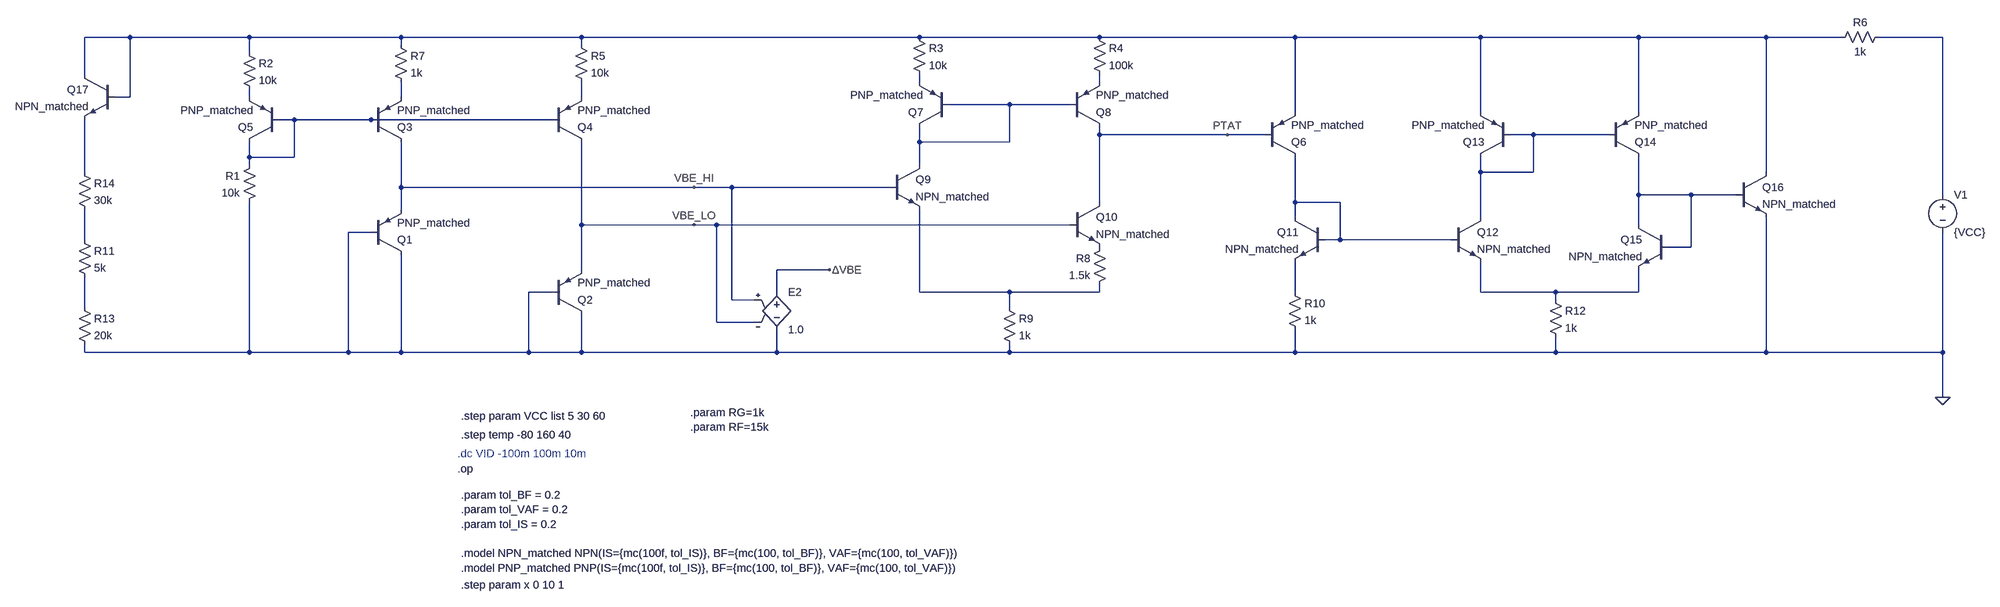
[diagram p0: schematic Shunt_Reference_1p2V.asc]
Shunt_Reference_1p2V.asc, the LTspice schematic file:
Version 4.1
SHEET 1 2692 1016
WIRE -1424 -416 -1520 -416
WIRE -1136 -416 -1424 -416
WIRE -768 -416 -1136 -416
WIRE -384 -416 -768 -416
WIRE 336 -416 -384 -416
WIRE 720 -416 336 -416
WIRE 1136 -416 720 -416
WIRE 1600 -416 1136 -416
WIRE 1936 -416 1600 -416
WIRE 2208 -416 1936 -416
WIRE 2368 -416 2208 -416
WIRE 2592 -416 2448 -416
WIRE -768 -400 -768 -416
WIRE -384 -400 -384 -416
WIRE -1136 -384 -1136 -416
WIRE -1520 -336 -1520 -416
WIRE 336 -320 336 -336
WIRE 720 -320 720 -336
WIRE -1424 -288 -1424 -416
WIRE -1424 -288 -1456 -288
WIRE -1136 -288 -1136 -304
WIRE -768 -288 -768 -320
WIRE -384 -288 -384 -320
WIRE 528 -272 400 -272
WIRE 656 -272 528 -272
WIRE 1136 -256 1136 -416
WIRE 1600 -256 1600 -416
WIRE 1936 -256 1936 -416
WIRE -1040 -240 -1072 -240
WIRE -832 -240 -1040 -240
WIRE -448 -240 -832 -240
WIRE 720 -208 720 -224
WIRE 992 -208 720 -208
WIRE 1072 -208 992 -208
WIRE 1712 -208 1664 -208
WIRE 1872 -208 1712 -208
WIRE 336 -192 336 -224
WIRE 528 -192 528 -272
WIRE 528 -192 336 -192
WIRE -1136 -160 -1136 -192
WIRE -1040 -160 -1040 -240
WIRE -1040 -160 -1136 -160
WIRE -1136 -144 -1136 -160
WIRE 336 -144 336 -192
WIRE -1520 -128 -1520 -240
WIRE 1600 -128 1600 -160
WIRE 1712 -128 1712 -208
WIRE 1712 -128 1600 -128
WIRE 2208 -128 2208 -416
WIRE -768 -96 -768 -192
WIRE -144 -96 -768 -96
WIRE -64 -96 -144 -96
WIRE 272 -96 -64 -96
WIRE 1936 -80 1936 -160
WIRE 2048 -80 1936 -80
WIRE 2144 -80 2048 -80
WIRE 2592 -80 2592 -416
WIRE 720 -64 720 -208
WIRE 1136 -64 1136 -160
WIRE 1232 -64 1136 -64
WIRE -768 -48 -768 -96
WIRE 1136 -32 1136 -64
WIRE 1600 -32 1600 -128
WIRE -384 -16 -384 -192
WIRE -144 -16 -384 -16
WIRE -96 -16 -144 -16
WIRE 656 -16 -96 -16
WIRE 1936 -16 1936 -80
WIRE -832 0 -880 0
WIRE -1520 16 -1520 -48
WIRE 1232 16 1232 -64
WIRE 1232 16 1200 16
WIRE 1536 16 1232 16
WIRE 2048 32 2048 -80
WIRE 2048 32 2000 32
WIRE -384 80 -384 -16
WIRE 144 80 32 80
WIRE -448 128 -496 128
WIRE 32 128 32 80
WIRE 336 128 336 -48
WIRE 528 128 336 128
WIRE 720 128 720 112
WIRE 720 128 528 128
WIRE 1136 128 1136 64
WIRE 1600 128 1600 64
WIRE 1760 128 1600 128
WIRE 1936 128 1936 80
WIRE 1936 128 1760 128
WIRE -64 144 -64 -96
WIRE -16 144 -64 144
WIRE 1760 144 1760 128
WIRE -1520 160 -1520 96
WIRE 528 160 528 128
WIRE -96 192 -96 -16
WIRE -16 192 -96 192
WIRE -1520 256 -1520 240
WIRE -1136 256 -1136 -64
WIRE -1136 256 -1520 256
WIRE -880 256 -880 0
WIRE -880 256 -1136 256
WIRE -768 256 -768 48
WIRE -768 256 -880 256
WIRE -496 256 -496 128
WIRE -496 256 -768 256
WIRE -384 256 -384 176
WIRE -384 256 -496 256
WIRE 32 256 32 208
WIRE 32 256 -384 256
WIRE 528 256 528 240
WIRE 528 256 32 256
WIRE 1136 256 1136 208
WIRE 1136 256 528 256
WIRE 1760 256 1760 224
WIRE 1760 256 1136 256
WIRE 2208 256 2208 -32
WIRE 2208 256 1760 256
WIRE 2592 256 2592 0
WIRE 2592 256 2208 256
WIRE 2592 352 2592 256
FLAG 2592 352 0
FLAG -144 -96 VBE_HI
FLAG -144 -16 VBE_LO
FLAG 144 80 ΔVBE
FLAG 992 -208 PTAT
SYMBOL voltage 2592 -96 R0
WINDOW 123 0 0 Left 0
WINDOW 39 0 0 Left 0
SYMATTR InstName V1
SYMATTR Value {VCC}
SYMBOL res -784 -416 R0
SYMATTR InstName R7
SYMATTR Value 1k
SYMBOL res -400 -416 R0
SYMATTR InstName R5
SYMATTR Value 10k
SYMBOL res 2464 -432 R90
WINDOW 0 0 56 VBottom 2
WINDOW 3 32 56 VTop 2
SYMATTR InstName R6
SYMATTR Value 1k
SYMBOL pnp -832 48 M180
SYMATTR InstName Q1
SYMATTR Value PNP_matched
SYMBOL pnp -448 176 M180
SYMATTR InstName Q2
SYMATTR Value PNP_matched
SYMBOL pnp -1072 -192 R180
SYMATTR InstName Q5
SYMATTR Value PNP_matched
SYMBOL res -1120 -160 M0
SYMATTR InstName R1
SYMATTR Value 10k
SYMBOL pnp -832 -192 M180
SYMATTR InstName Q3
SYMATTR Value PNP_matched
SYMBOL pnp -448 -192 M180
SYMATTR InstName Q4
SYMATTR Value PNP_matched
SYMBOL res -1152 -400 R0
SYMATTR InstName R2
SYMATTR Value 10k
SYMBOL pnp 1072 -160 M180
SYMATTR InstName Q6
SYMATTR Value PNP_matched
SYMBOL res 320 -432 R0
SYMATTR InstName R3
SYMATTR Value 10k
SYMBOL res 704 -432 R0
SYMATTR InstName R4
SYMATTR Value 100k
SYMBOL pnp 400 -224 R180
SYMATTR InstName Q7
SYMATTR Value PNP_matched
SYMBOL pnp 656 -224 M180
SYMATTR InstName Q8
SYMATTR Value PNP_matched
SYMBOL npn 272 -144 R0
SYMATTR InstName Q9
SYMATTR Value NPN_matched
SYMBOL npn 656 -64 R0
SYMATTR InstName Q10
SYMATTR Value NPN_matched
SYMBOL res 736 16 M0
SYMATTR InstName R8
SYMATTR Value 1.5k
SYMBOL res 512 144 R0
SYMATTR InstName R9
SYMATTR Value 1k
SYMBOL e 32 112 R0
SYMATTR InstName E2
SYMATTR Value 1.0
SYMBOL npn 1200 -32 M0
SYMATTR InstName Q11
SYMATTR Value NPN_matched
SYMBOL npn 1536 -32 R0
SYMATTR InstName Q12
SYMATTR Value NPN_matched
SYMBOL res 1120 112 R0
SYMATTR InstName R10
SYMATTR Value 1k
SYMBOL pnp 1664 -160 R180
SYMATTR InstName Q13
SYMATTR Value PNP_matched
SYMBOL pnp 1872 -160 M180
SYMATTR InstName Q14
SYMATTR Value PNP_matched
SYMBOL npn 2000 -16 M0
SYMATTR InstName Q15
SYMATTR Value NPN_matched
SYMBOL res 1744 128 R0
SYMATTR InstName R12
SYMATTR Value 1k
SYMBOL npn 2144 -128 R0
SYMATTR InstName Q16
SYMATTR Value NPN_matched
SYMBOL npn -1456 -336 M0
SYMATTR InstName Q17
SYMATTR Value NPN_matched
SYMBOL res -1536 0 R0
SYMATTR InstName R11
SYMATTR Value 5k
SYMBOL res -1536 144 R0
SYMATTR InstName R13
SYMATTR Value 20k
SYMBOL res -1536 -144 R0
SYMATTR InstName R14
SYMATTR Value 30k
TEXT -648 472 Left 2 ;.dc VID -100m 100m 10m
TEXT -640 432 Left 2 !.step temp -80 160 40
TEXT -640 560 Left 2 !.param tol_BF = 0.2\n.param tol_VAF = 0.2\n.param tol_IS = 0.2\n \n.model NPN_matched NPN(IS={mc(100f, tol_IS)}, BF={mc(100, tol_BF)}, VAF={mc(100, tol_VAF)})\n.model PNP_matched PNP(IS={mc(100f, tol_IS)}, BF={mc(100, tol_BF)}, VAF={mc(100, tol_VAF)})
TEXT -640 752 Left 2 !.step param x 0 10 1
TEXT -648 504 Left 2 !.op
TEXT -640 392 Left 2 !.step param VCC list 5 30 60
TEXT -152 384 Left 2 !.param RG=1k\n.param RF=15k

The netlist it stands for:
* Shunt_Reference_1p2V.asc
V1 N002 0 {VCC}
R7 N001 N006 1k
R5 N001 N007 10k
R6 N002 N001 1k
Q1 0 0 VBE_HI 0 PNP_matched
Q2 0 0 VBE_LO 0 PNP_matched
Q5 N009 N009 N005 0 PNP_matched
R1 N009 0 10k
Q3 VBE_HI N009 N006 0 PNP_matched
Q4 VBE_LO N009 N007 0 PNP_matched
R2 N001 N005 10k
Q6 N013 PTAT N001 0 PNP_matched
R3 N001 N003 10k
R4 N001 N004 100k
Q7 N008 N008 N003 0 PNP_matched
Q8 PTAT N008 N004 0 PNP_matched
Q9 N008 VBE_HI N015 0 NPN_matched
Q10 PTAT VBE_LO P001 0 NPN_matched
R8 P001 N015 1.5k
R9 N015 0 1k
E2 ΔVBE 0 VBE_HI VBE_LO 1.0
Q11 N013 N013 N016 0 NPN_matched
Q12 N010 N013 N017 0 NPN_matched
R10 N016 0 1k
Q13 N010 N010 N001 0 PNP_matched
Q14 N012 N010 N001 0 PNP_matched
Q15 N012 N012 N017 0 NPN_matched
R12 N017 0 1k
Q16 N001 N012 0 0 NPN_matched
Q17 N001 N001 N011 0 NPN_matched
R11 N014 N018 5k
R13 N018 0 20k
R14 N011 N014 30k
.model NPN NPN
.model PNP PNP
.lib standard.bjt
* .dc VID -100m 100m 10m
.step temp -80 160 40
.param tol_BF = 0.2
.param tol_VAF = 0.2
.param tol_IS = 0.2
.model NPN_matched NPN(IS={mc(100f, tol_IS)}, BF={mc(100, tol_BF)}, VAF={mc(100, tol_VAF)})
.model PNP_matched PNP(IS={mc(100f, tol_IS)}, BF={mc(100, tol_BF)}, VAF={mc(100, tol_VAF)})
.step param x 0 10 1
.op
.step param VCC list 5 30 60
.param RG=1k
.param RF=15k
.backanno
.end